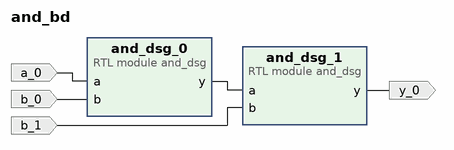
[diagram p0: block diagram of the top level]
# Vivado block design and_bd, xc7a200tfbg676-2, Vivado 2026.1
create_bd_design and_bd

create_bd_port -dir I a_0
create_bd_port -dir I b_0
create_bd_port -dir I b_1
create_bd_port -dir O y_0

create_bd_cell -type module -reference and_dsg and_dsg_0
create_bd_cell -type module -reference and_dsg and_dsg_1

# ---- connections ----

connect_bd_net -net a_0_1 [get_bd_ports a_0] [get_bd_pins and_dsg_0/a]
connect_bd_net [get_bd_pins and_dsg_0/y] [get_bd_pins and_dsg_1/a]
connect_bd_net [get_bd_pins and_dsg_1/y] [get_bd_ports y_0]
connect_bd_net -net b_0_1 [get_bd_ports b_0] [get_bd_pins and_dsg_0/b]
connect_bd_net -net b_1_1 [get_bd_ports b_1] [get_bd_pins and_dsg_1/b]

validate_bd_design
save_bd_design
